# Altium schematic sheet Temperature_Sense_Section.SchDoc (part 1 of 2)
size 420 x 297 mm; DocumentNumber: 15; SheetNumber: 15; SheetTotal: 17
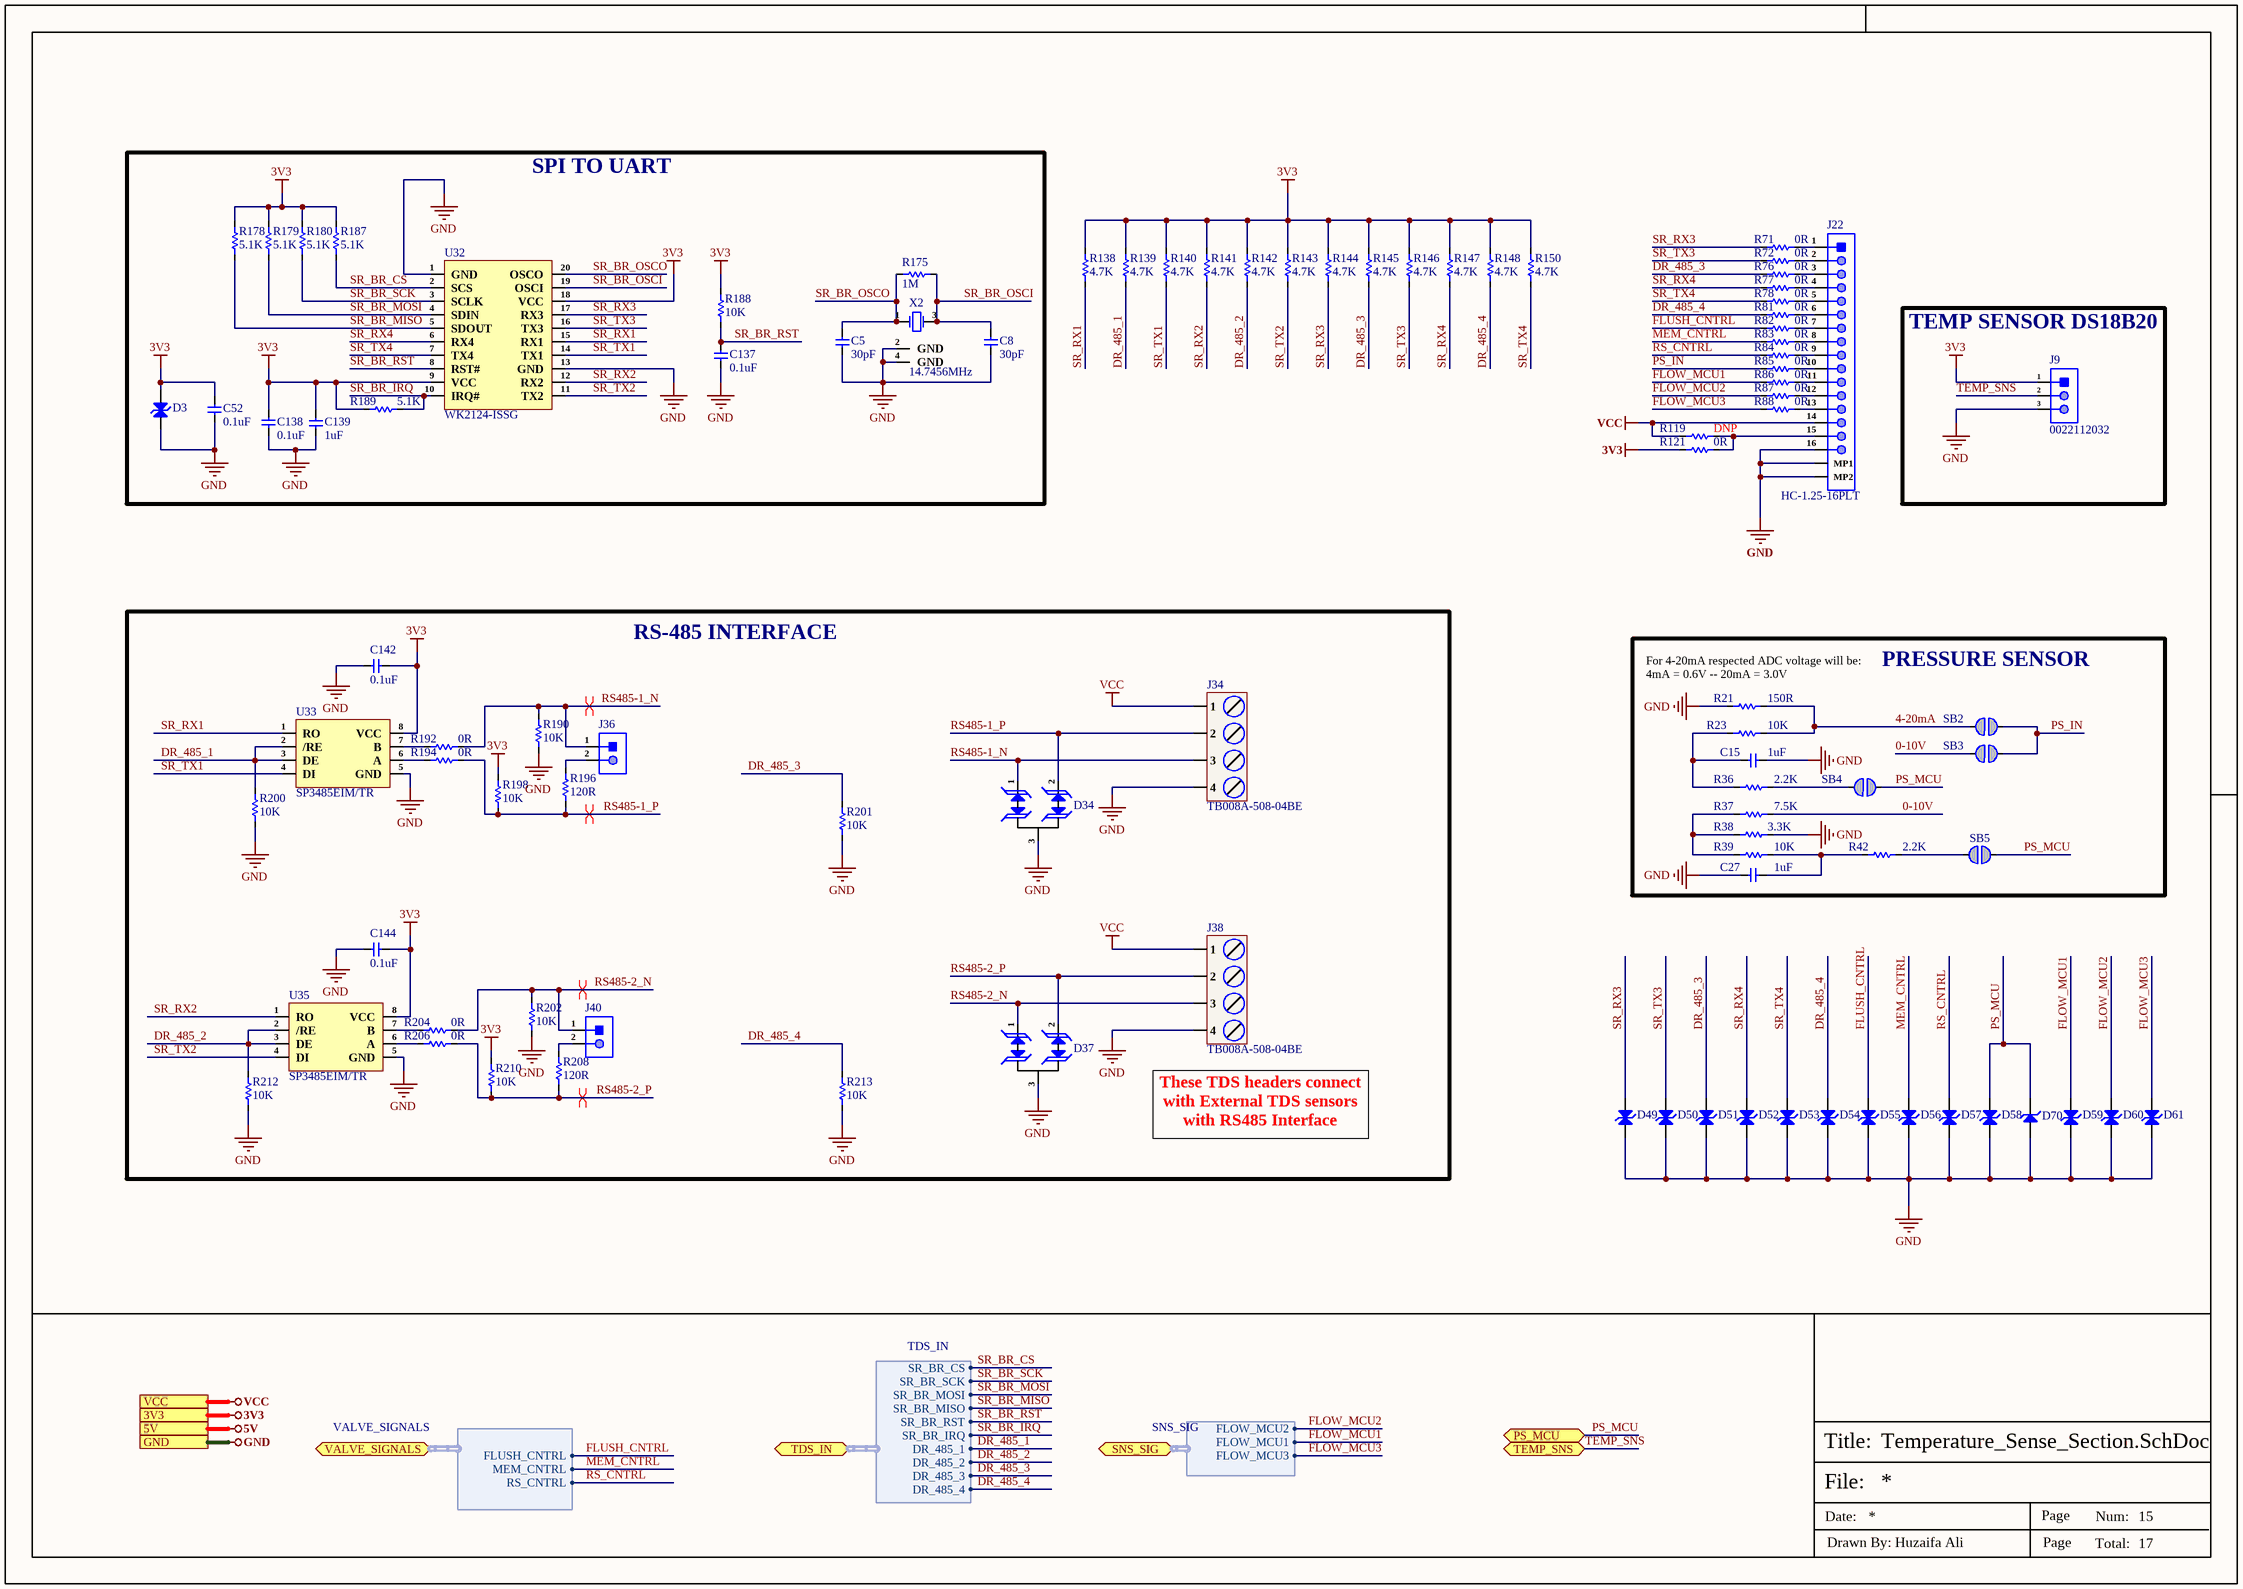
[diagram p0: Temperature_Sense_Section.SchDoc]

## Parts
C5  30pF  [Cap-0402]
C8  30pF  [Cap-0402]
C15  1uF  [Cap-0603]
C27  1uF  [Cap-0603]
C52  0.1uF  [Cap-0603]
C137  0.1uF  [Cap-0402]
C138  0.1uF  [Cap-0402]
C139  1uF  [Cap-0402]
C142  0.1uF  [Cap-0402]
C144  0.1uF  [Cap-0402]
D3  SMAJ5.0CA  [SMA Bi Directional]  (value not drawn)
D34  SM712  [SOT-23]  (value not drawn)
D37  SM712  [SOT-23]  (value not drawn)
D49  LESD8D3.3CAT5G  [SOD-882 Bi Directional]  (value not drawn)
D50  LESD8D3.3CAT5G  [SOD-882 Bi Directional]  (value not drawn)
D51  LESD8D3.3CAT5G  [SOD-882 Bi Directional]  (value not drawn)
D52  LESD8D3.3CAT5G  [SOD-882 Bi Directional]  (value not drawn)
D53  LESD8D3.3CAT5G  [SOD-882 Bi Directional]  (value not drawn)
D54  LESD8D3.3CAT5G  [SOD-882 Bi Directional]  (value not drawn)
D55  LESD8D3.3CAT5G  [SOD-882 Bi Directional]  (value not drawn)
D56  LESD8D3.3CAT5G  [SOD-882 Bi Directional]  (value not drawn)
D57  LESD8D3.3CAT5G  [SOD-882 Bi Directional]  (value not drawn)
D58  LESD8D3.3CAT5G  [SOD-882 Bi Directional]  (value not drawn)
D59  LESD8D3.3CAT5G  [SOD-882 Bi Directional]  (value not drawn)
D60  LESD8D3.3CAT5G  [SOD-882 Bi Directional]  (value not drawn)
D61  LESD8D3.3CAT5G  [SOD-882 Bi Directional]  (value not drawn)
D70  MM3Z3V3B  [SOD323F]  (value not drawn)
J9  0022112032  [0022112032]
J22  HC-1.25-16PLT  [HC-1.25-16PLT]
J34  TB008A-508-04BE  [TB008A-508-04BE]
J36  X6511WV-02H-C60D30  [HDR1X2_]  (value not drawn)
J38  TB008A-508-04BE  [TB008A-508-04BE]
J40  X6511WV-02H-C60D30  [HDR1X2_]  (value not drawn)
R21  150R  [Res-0603]
R23  10K  [Res-0603]
R36  2.2K  [Res-0603]
R37  7.5K  [Res-0603]
R38  3.3K  [Res-0603]
R39  10K  [Res-0603]
R42  2.2K  [Res-0603]
R71  0R  [Res-0603]
R72  0R  [Res-0603]
R76  0R  [Res-0603]
R77  0R  [Res-0603]
R78  0R  [Res-0603]
R81  0R  [Res-0603]
R82  0R  [Res-0603]
R83  0R  [Res-0603]
R84  0R  [Res-0603]
R85  0R  [Res-0603]
R86  0R  [Res-0603]
R87  0R  [Res-0603]
R88  0R  [Res-0603]
R119  DNP  [Res-1206]
R121  0R  [Res-1206]
R138  4.7K  [Res-0402]
R139  4.7K  [Res-0402]
R140  4.7K  [Res-0402]
R141  4.7K  [Res-0402]
R142  4.7K  [Res-0402]
R143  4.7K  [Res-0402]
R144  4.7K  [Res-0402]
R145  4.7K  [Res-0402]
R146  4.7K  [Res-0402]
R147  4.7K  [Res-0402]
R148  4.7K  [Res-0402]
R150  4.7K  [Res-0402]
R175  1M  [Res-0402]
R178  5.1K  [Res-0402]
R179  5.1K  [Res-0402]
R180  5.1K  [Res-0402]
R187  5.1K  [Res-0402]
R188  10K  [Res-0402]
R189  5.1K  [Res-0402]
R190  10K  [Res-0402]
R192  0R  [Res-0402]
R194  0R  [Res-0402]
R196  120R  [Res-0603]
R198  10K  [Res-0402]
R200  10K  [Res-0402]
R201  10K  [Res-0402]
R202  10K  [Res-0402]
R204  0R  [Res-0402]
R206  0R  [Res-0402]
R208  120R  [Res-0603]
R210  10K  [Res-0402]
R212  10K  [Res-0402]
R213  10K  [Res-0402]
SB2  Solder Bridge 0603  [Solder Bridge]  (value not drawn)  (no BOM)
SB3  Solder Bridge 0603  [Solder Bridge]  (value not drawn)  (no BOM)
SB4  Solder Bridge 0603  [Solder Bridge]  (value not drawn)  (no BOM)
SB5  Solder Bridge 0603  [Solder Bridge]  (value not drawn)  (no BOM)
U32  WK2124-ISSG  [SSOP-20-208mil]
U33  SP3485EIM/TR  [SOP-8]
U35  SP3485EIM/TR  [SOP-8]
X2  14.7456MHz  [SMD3225-4P]

## Blocks framed on the sheet
SPI TO UART: C5 C8 C52 C137-C139 D3 R175 R178-R180 R187-R189 U32 X2
TEMP SENSOR DS18B20: J9
RS-485 INTERFACE: C142 C144 D34 D37 J34 J36 J38 J40 R190 R192 R194 R196 R198 R200-R202 R204 R206 R208 R210 R212 R213 U33 U35
PRESSURE SENSOR: C15 C27 R21 R23 R36-R39 R42 SB2-SB5

## Ports
3V3, 5V, GND, PS_MCU (bidir), SNS_SIG (bidir, harness SNS_SIG), TDS_IN (bidir, harness TDS_IN), TEMP_SNS (bidir), VALVE_SIGNALS (bidir, harness VALVE_SIGNALS), VCC

## Harnesses
TDS_IN: SR_BR_RST, SR_BR_IRQ, DR_485_1, DR_485_2, SR_BR_CS, SR_BR_SCK, SR_BR_MOSI, SR_BR_MISO, DR_485_3, DR_485_4
SNS_SIG: FLOW_MCU1, FLOW_MCU2, FLOW_MCU3
VALVE_SIGNALS: FLUSH_CNTRL, MEM_CNTRL, RS_CNTRL

## Nets
3V3: C52.2 C138.1 C139.2 C142.2 C144.2 D3.2(K) J9.1 R121.1 R138.2 R139.2 R140.2 R141.2 R142.2 R143.2 R144.2 R145.2 R146.2 R147.2 R148.2 R150.2 R178.2 R179.2 R180.2 R187.2 R188.2 R189.2 R198.1 R210.1 U32.9(VCC) U32.18(VCC) U33.8(VCC) U35.8(VCC) ; port 3V3
5V: port 5V
GND: C5.1 C8.1 C15.2 C27.1 C52.1 C137.1 C138.2 C139.1 C142.1 C144.1 D3.1(A) D34.3(GND) D37.3(GND) D49.1(A) D50.1(A) D51.1(A) D52.1(A) D53.1(A) D54.1(A) D55.1(A) D56.1(A) D57.1(A) D58.1(A) D59.1(A) D60.1(A) D61.1(A) D70.1(A) J9.3 J22.16 J22.MP1 J22.MP2 J34.4 J38.4 R21.1 R38.2 R190.2 R200.2 R201.2 R202.2 R212.2 R213.2 U32.1(GND) U32.13(GND) U33.5(GND) U35.5(GND) X2.2(GND) X2.4(GND) ; port GND
VCC: J22.14 J34.1 J38.1 R119.1 ; port VCC
0-10V: R37.2 SB3.2
4-20mA: R21.2 R23.2 SB2.2
DR_485_1: R139.1 R200.1 U33.2(/RE) U33.3(DE) ; port TDS_IN.DR_485_1
DR_485_2: R142.1 R212.1 U35.2(/RE) U35.3(DE) ; port TDS_IN.DR_485_2
DR_485_3: D51.2(A) R76.1 R145.1 R201.1 ; port TDS_IN.DR_485_3
DR_485_4: D54.2(A) R81.1 R148.1 R213.1 ; port TDS_IN.DR_485_4
FLOW_MCU1: D59.2(A) R86.1 ; port SNS_SIG.FLOW_MCU1
FLOW_MCU2: D60.2(A) R87.1 ; port SNS_SIG.FLOW_MCU2
FLOW_MCU3: D61.2(A) R88.1 ; port SNS_SIG.FLOW_MCU3
FLUSH_CNTRL: D55.2(A) R82.1 ; port VALVE_SIGNALS.FLUSH_CNTRL
MEM_CNTRL: D56.2(A) R83.1 ; port VALVE_SIGNALS.MEM_CNTRL
PS_IN: R85.1 SB2.1 SB3.1
PS_MCU: D58.2(A) D70.2(K) SB4.1 SB5.1 ; port PS_MCU
RS485-1_N: D34.1(I/O1) J34.3 J36.1 R190.1 R192.2
RS485-1_P: D34.2(I/O2) J34.2 R194.2 R196.1 R198.2
RS485-2_N: D37.1(I/O1) J38.3 J40.1 R202.1 R204.2
RS485-2_P: D37.2(I/O2) J38.2 R206.2 R208.1 R210.2
RS_CNTRL: D57.2(A) R84.1 ; port VALVE_SIGNALS.RS_CNTRL
SR_BR_CS: R187.1 U32.2(SCS) ; port TDS_IN.SR_BR_CS
SR_BR_IRQ: R189.1 U32.10(IRQ#) ; port TDS_IN.SR_BR_IRQ
SR_BR_MISO: R178.1 U32.5(SDOUT) ; port TDS_IN.SR_BR_MISO
SR_BR_MOSI: R179.1 U32.4(SDIN) ; port TDS_IN.SR_BR_MOSI
SR_BR_OSCI: C8.2 R175.2 U32.19(OSCI) X2.3(OSC2)
SR_BR_OSCO: C5.2 R175.1 U32.20(OSCO) X2.1(OSC1)
SR_BR_RST: C137.2 R188.1 U32.8(RST#) ; port TDS_IN.SR_BR_RST
SR_BR_SCK: R180.1 U32.3(SCLK) ; port TDS_IN.SR_BR_SCK
SR_RX1: R138.1 U32.15(RX1) U33.1(RO)
SR_RX2: R141.1 U32.12(RX2) U35.1(RO)
SR_RX3: D49.2(A) R71.1 R144.1 U32.17(RX3)
SR_RX4: D52.2(A) R77.1 R147.1 U32.6(RX4)
SR_TX1: R140.1 U32.14(TX1) U33.4(DI)
SR_TX2: R143.1 U32.11(TX2) U35.4(DI)
SR_TX3: D50.2(A) R72.1 R146.1 U32.16(TX3)
SR_TX4: D53.2(A) R78.1 R150.1 U32.7(TX4)
TEMP_SNS: J9.2 ; port TEMP_SNS
NetC15_1: C15.1 R23.1 R36.1
NetC27_2: C27.2 R39.2 R42.1
NetJ22_1: J22.1 R71.2
NetJ22_2: J22.2 R72.2
NetJ22_3: J22.3 R76.2
NetJ22_4: J22.4 R77.2
NetJ22_5: J22.5 R78.2
NetJ22_6: J22.6 R81.2
NetJ22_7: J22.7 R82.2
NetJ22_8: J22.8 R83.2
NetJ22_9: J22.9 R84.2
NetJ22_10: J22.10 R85.2
NetJ22_11: J22.11 R86.2
NetJ22_12: J22.12 R87.2
NetJ22_13: J22.13 R88.2
NetJ22_15: J22.15 R119.2 R121.2
NetJ36_2: J36.2 R196.2
NetJ40_2: J40.2 R208.2
NetR36_2: R36.2 SB4.2
NetR37_1: R37.1 R38.1 R39.1
NetR42_2: R42.2 SB5.2
NetR192_1: R192.1 U33.7(B)
NetR194_1: R194.1 U33.6(A)
NetR204_1: R204.1 U35.7(B)
NetR206_1: R206.1 U35.6(A)

## Layout directives
differential pair: RS485-1_N, RS485-1_P, RS485-2_N, RS485-2_P

## Notes on the sheet
- (near R21) For 4-20mA respected ADC voltage will be:
  4mA = 0.6V -- 20mA = 3.0V
- (near J38) These TDS headers connect with External TDS sensors with RS485 Interface
- File:
- Title:
- Date:
- Page
- Num:
- Total:
- Drawn By: Huzaifa Ali